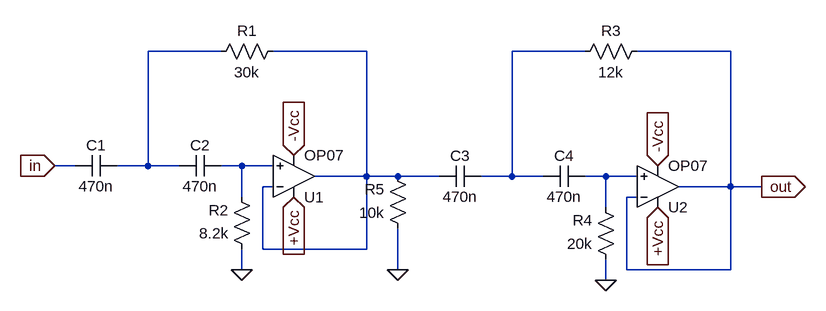
[diagram p0: schematic High_Pass_updated.asc]
High_Pass_updated.asc, the LTspice schematic file:
Version 4.1
SHEET 1 1492 680
WIRE -352 32 -464 32
WIRE -128 32 -272 32
WIRE 208 32 96 32
WIRE 432 32 288 32
WIRE -576 208 -608 208
WIRE -464 208 -464 32
WIRE -464 208 -512 208
WIRE -416 208 -464 208
WIRE -320 208 -352 208
WIRE -272 208 -320 208
WIRE -128 224 -128 32
WIRE -128 224 -208 224
WIRE -80 224 -128 224
WIRE -16 224 -80 224
WIRE 96 224 96 32
WIRE 96 224 48 224
WIRE 144 224 96 224
WIRE 240 224 208 224
WIRE 288 224 240 224
WIRE -272 240 -288 240
WIRE 432 240 432 32
WIRE 432 240 352 240
WIRE 480 240 432 240
WIRE -320 256 -320 208
WIRE 288 256 272 256
WIRE 240 272 240 224
WIRE -288 336 -288 240
WIRE -128 336 -128 224
WIRE -128 336 -288 336
WIRE -320 368 -320 336
WIRE -80 368 -80 304
WIRE 272 368 272 256
WIRE 432 368 432 240
WIRE 432 368 272 368
WIRE 240 384 240 352
FLAG -240 256 +Vcc
IOPIN -240 256 In
FLAG -240 192 -Vcc
IOPIN -240 192 In
FLAG -320 368 0
FLAG -80 368 0
FLAG 320 272 +Vcc
IOPIN 320 272 In
FLAG 320 208 -Vcc
IOPIN 320 208 In
FLAG 240 384 0
FLAG -608 208 in
IOPIN -608 208 In
FLAG 480 240 out
IOPIN 480 240 Out
SYMBOL cap -512 192 R90
WINDOW 0 0 32 VBottom 2
WINDOW 3 32 32 VTop 2
SYMATTR InstName C1
SYMATTR Value 470n
SYMBOL cap -352 192 R90
WINDOW 0 0 32 VBottom 2
WINDOW 3 32 32 VTop 2
SYMATTR InstName C2
SYMATTR Value 470n
SYMBOL res -256 16 R90
WINDOW 0 0 56 VBottom 2
WINDOW 3 32 56 VTop 2
SYMATTR InstName R1
SYMATTR Value 30k
SYMBOL res -304 352 R180
WINDOW 0 36 76 Left 2
WINDOW 3 36 40 Left 2
SYMATTR InstName R2
SYMATTR Value 8.2k
SYMBOL OpAmps\\OP07 -240 288 M180
SYMATTR InstName U1
SYMBOL res -64 320 R180
WINDOW 0 36 76 Left 2
WINDOW 3 36 40 Left 2
SYMATTR InstName R5
SYMATTR Value 10k
SYMBOL cap 48 208 R90
WINDOW 0 0 32 VBottom 2
WINDOW 3 32 32 VTop 2
SYMATTR InstName C3
SYMATTR Value 470n
SYMBOL cap 208 208 R90
WINDOW 0 0 32 VBottom 2
WINDOW 3 32 32 VTop 2
SYMATTR InstName C4
SYMATTR Value 470n
SYMBOL res 304 16 R90
WINDOW 0 0 56 VBottom 2
WINDOW 3 32 56 VTop 2
SYMATTR InstName R3
SYMATTR Value 12k
SYMBOL res 256 368 R180
WINDOW 0 36 76 Left 2
WINDOW 3 36 40 Left 2
SYMATTR InstName R4
SYMATTR Value 20k
SYMBOL OpAmps\\OP07 320 304 M180
SYMATTR InstName U2

The netlist it stands for:
* High_Pass_updated.asc
C1 N001 in 470n
C2 N004 N001 470n
R1 N002 N001 30k
R2 0 N004 8.2k
X§U1 N004 N002 +Vcc -Vcc N002 LT1001  ; OP07, pins In+ In- V+ V- OUT
R5 0 N002 10k
C3 N003 N002 470n
C4 N005 N003 470n
R3 out N003 12k
R4 0 N005 20k
X§U2 N005 out +Vcc -Vcc out LT1001  ; OP07, pins In+ In- V+ V- OUT
.lib LTC.lib
.backanno
.end